# Altium project IoT-Speaker.PrjPcb (part 1 of 5)
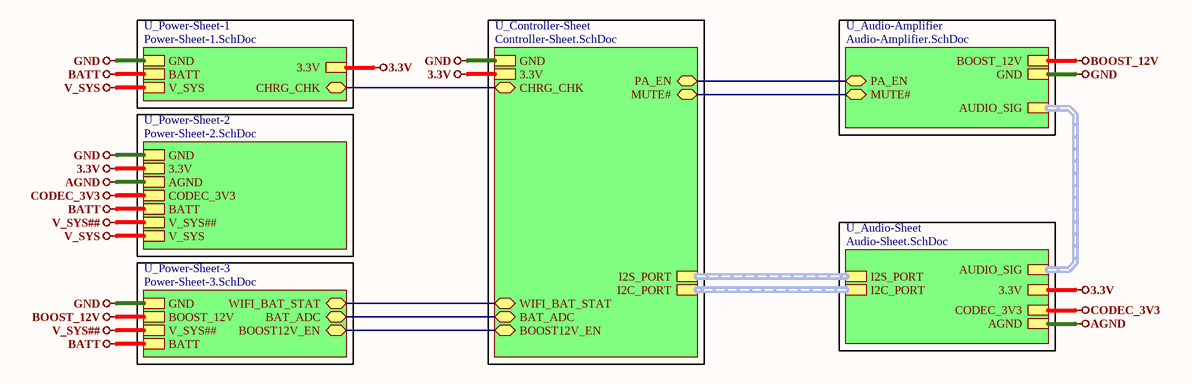
[diagram p0: Top-Sheet.SchDoc]
7 sheets, 210 parts. Net scope: hierarchical (ports join the sheet entries above them; power ports are global).
Board file: IOT_Speaker.PcbDoc
Sheets:
  Top-Sheet.SchDoc
    U_Audio-Amplifier = Audio-Amplifier.SchDoc
    U_Audio-Sheet = Audio-Sheet.SchDoc
    U_Controller-Sheet = Controller-Sheet.SchDoc
    U_Power-Sheet-2 = Power-Sheet-2.SchDoc
    U_Power-Sheet-3 = Power-Sheet-3.SchDoc
    U_Power-Sheet-1 = Power-Sheet-1.SchDoc

## Sheet Top-Sheet.SchDoc
size A4; SheetNumber: 1; SheetTotal: 7

### Sub-sheets
U_Audio-Amplifier = Audio-Amplifier.SchDoc: PA_EN (bidir), AUDIO_SIG (harness AUDIO_SIG), GND, BOOST_12V, MUTE# (bidir)
U_Audio-Sheet = Audio-Sheet.SchDoc: 3.3V, I2S_PORT (harness I2S_PORT), I2C_PORT (harness I2C_PORT), AGND, CODEC_3V3, AUDIO_SIG (harness AUDIO_SIG)
U_Controller-Sheet = Controller-Sheet.SchDoc: I2S_PORT (harness I2S_PORT), CHRG_CHK (bidir), BOOST12V_EN (bidir), GND, 3.3V, I2C_PORT (harness I2C_PORT), PA_EN (bidir), MUTE# (bidir), WIFI_BAT_STAT (bidir), BAT_ADC (bidir)
U_Power-Sheet-1 = Power-Sheet-1.SchDoc: GND, CHRG_CHK (bidir), BATT, V_SYS, 3.3V
U_Power-Sheet-2 = Power-Sheet-2.SchDoc: GND, 3.3V, AGND, CODEC_3V3, BATT, V_SYS##, V_SYS
U_Power-Sheet-3 = Power-Sheet-3.SchDoc: GND, BOOST_12V, BOOST12V_EN (bidir), V_SYS##, WIFI_BAT_STAT (bidir), BAT_ADC (bidir), BATT

### Nets
3.3V: sheet U_Audio-Sheet/3.3V, sheet U_Controller-Sheet/3.3V, sheet U_Power-Sheet-2/3.3V, sheet U_Power-Sheet-1/3.3V
AGND: sheet U_Audio-Sheet/AGND, sheet U_Power-Sheet-2/AGND
BATT: sheet U_Power-Sheet-2/BATT, sheet U_Power-Sheet-3/BATT, sheet U_Power-Sheet-1/BATT
BOOST_12V: sheet U_Audio-Amplifier/BOOST_12V, sheet U_Power-Sheet-3/BOOST_12V
CODEC_3V3: sheet U_Audio-Sheet/CODEC_3V3, sheet U_Power-Sheet-2/CODEC_3V3
GND: sheet U_Audio-Amplifier/GND, sheet U_Controller-Sheet/GND, sheet U_Power-Sheet-2/GND, sheet U_Power-Sheet-3/GND, sheet U_Power-Sheet-1/GND
V_SYS: sheet U_Power-Sheet-2/V_SYS, sheet U_Power-Sheet-1/V_SYS
V_SYS##: sheet U_Power-Sheet-2/V_SYS##, sheet U_Power-Sheet-3/V_SYS##
BAT_ADC: sheet U_Controller-Sheet/BAT_ADC, sheet U_Power-Sheet-3/BAT_ADC
BOOST12V_EN: sheet U_Controller-Sheet/BOOST12V_EN, sheet U_Power-Sheet-3/BOOST12V_EN
CHRG_CHK: sheet U_Controller-Sheet/CHRG_CHK, sheet U_Power-Sheet-1/CHRG_CHK
MUTE#: sheet U_Audio-Amplifier/MUTE#, sheet U_Controller-Sheet/MUTE#
PA_EN: sheet U_Audio-Amplifier/PA_EN, sheet U_Controller-Sheet/PA_EN
WIFI_BAT_STAT: sheet U_Controller-Sheet/WIFI_BAT_STAT, sheet U_Power-Sheet-3/WIFI_BAT_STAT

### Buses and harness runs
harness sheet U_Audio-Amplifier/AUDIO_SIG = sheet U_Audio-Sheet/AUDIO_SIG
harness sheet U_Audio-Sheet/I2C_PORT = sheet U_Controller-Sheet/I2C_PORT
harness sheet U_Audio-Sheet/I2S_PORT = sheet U_Controller-Sheet/I2S_PORT

### Notes on the sheet
- File:
- Title:
- Date:
- Page
- Num:
- Total:
- Drawn By: Huzaifa Ali

## Sheet Audio-Amplifier.SchDoc
size A4; SheetNumber: 7; SheetTotal: 7
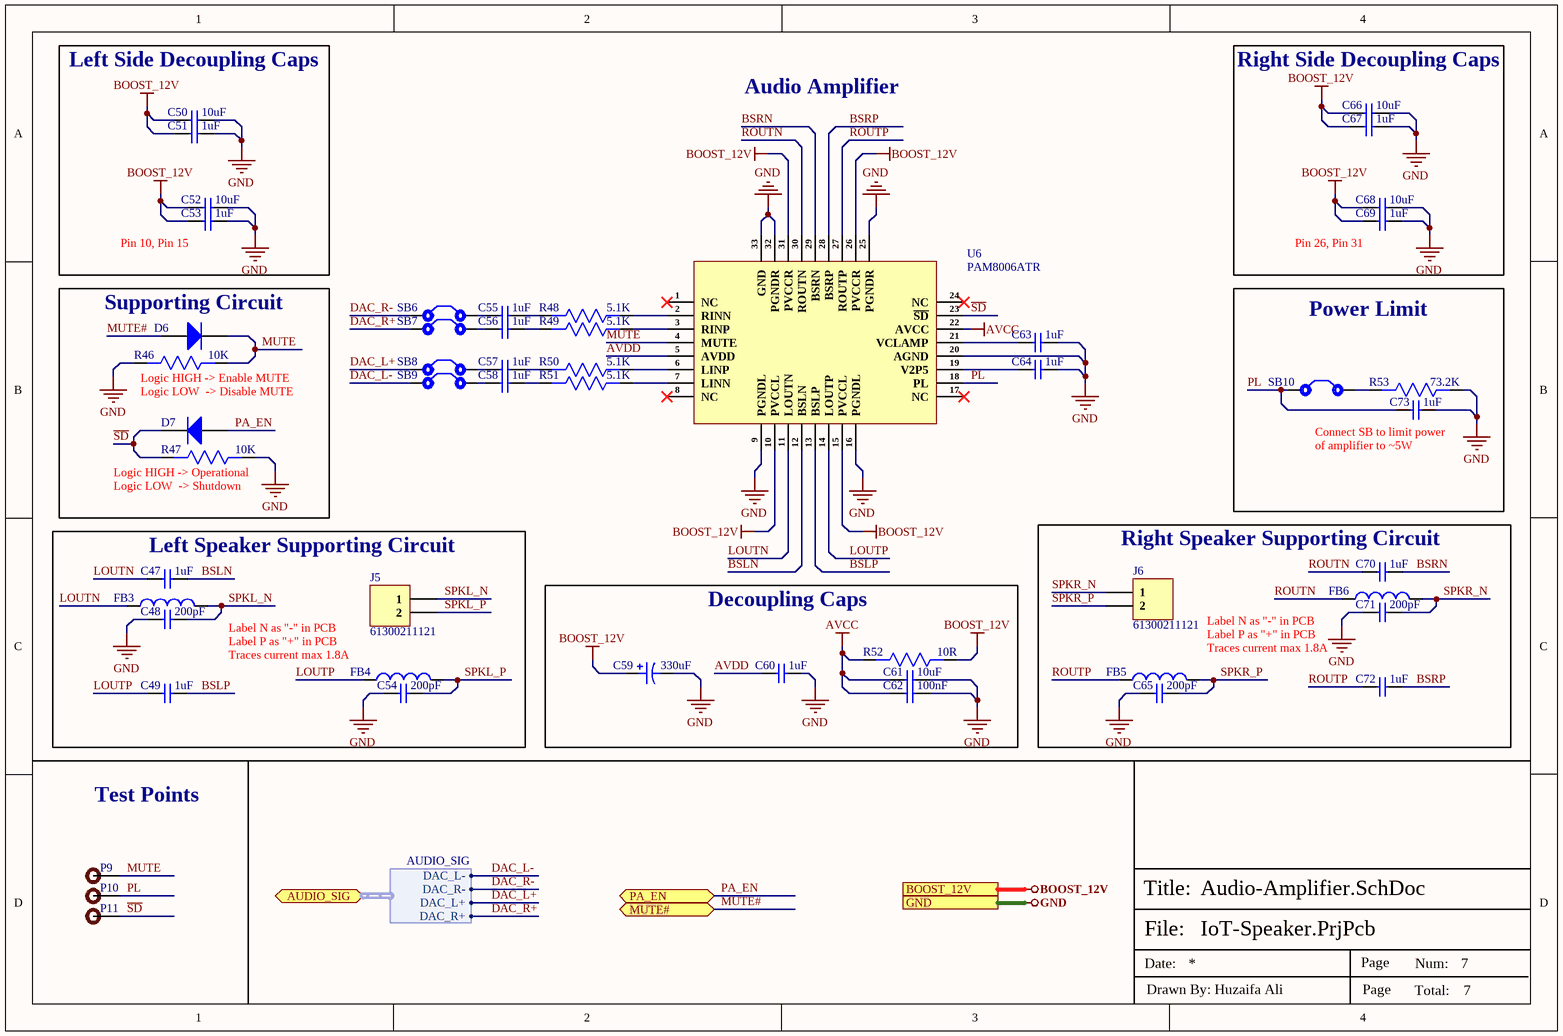
[diagram p1: Audio-Amplifier.SchDoc]

### Parts
C47  1uF  [Cap-0603]
C48  200pF  [Cap-0603]
C49  1uF  [Cap-0603]
C50  10uF  [Cap-0805]
C51  1uF  [Cap-0603]
C52  10uF  [Cap-0805]
C53  1uF  [Cap-0603]
C54  200pF  [Cap-0603]
C55  1uF  [Cap-0603]
C56  1uF  [Cap-0603]
C57  1uF  [Cap-0603]
C58  1uF  [Cap-0603]
C59  330uF  [25SVPF330M]
C60  1uF  [Cap-0603]
C61  10uF  [Cap-0805]
C62  100nF  [Cap-0402]
C63  1uF  [Cap-0603]
C64  1uF  [Cap-0603]
C65  200pF  [Cap-0603]
C66  10uF  [Cap-0805]
C67  1uF  [Cap-0603]
C68  10uF  [Cap-0805]
C69  1uF  [Cap-0603]
C70  1uF  [Cap-0603]
C71  200pF  [Cap-0603]
C72  1uF  [Cap-0603]
C73  1uF  [Cap-0603]
D6  1N4148WS-7-F  [SOD-323]  (value not drawn)
D7  1N4148WS-7-F  [SOD-323]  (value not drawn)
FB3  FBMH3225HM601NT  [IND-1210]  (value not drawn)
FB4  FBMH3225HM601NT  [IND-1210]  (value not drawn)
FB5  FBMH3225HM601NT  [IND-1210]  (value not drawn)
FB6  FBMH3225HM601NT  [IND-1210]  (value not drawn)
J5  61300211121  [HDR1X2_]
J6  61300211121  [HDR1X2_]
P9  TEST POINT  [Test-point]  (value not drawn)
P10  TEST POINT  [Test-point]  (value not drawn)
P11  TEST POINT  [Test-point]  (value not drawn)
R46  10K  [Res-0603]
R47  10K  [Res-0603]
R48  5.1K  [Res-0603]
R49  5.1K  [Res-0603]
R50  5.1K  [Res-0603]
R51  5.1K  [Res-0603]
R52  10R  [Res-0603]
R53  73.2K  [Res-0603]
SB6  Solder Bridge 0402  [Solder Bridge 0402]  (value not drawn)
SB7  Solder Bridge 0402  [Solder Bridge 0402]  (value not drawn)
SB8  Solder Bridge 0402  [Solder Bridge 0402]  (value not drawn)
SB9  Solder Bridge 0402  [Solder Bridge 0402]  (value not drawn)
SB10  Solder Bridge 0402  [Solder Bridge 0402]  (value not drawn)
U6  PAM8006ATR  [32-QFN]

### Blocks framed on the sheet
Left Side Decoupling Caps: C50-C53
Right Side Decoupling Caps: C66-C69
Supporting Circuit: D6 D7 R46 R47
Power Limit: C73 R53 SB10
Left Speaker Supporting Circuit: C47-C49 C54 FB3 FB4 J5
Right Speaker Supporting Circuit: C65 C70-C72 FB5 FB6 J6
Decoupling Caps: C59-C62 R52

### Ports
AUDIO_SIG (bidir, harness AUDIO_SIG), BOOST_12V, GND, MUTE# (bidir), PA_EN (bidir)

### Harnesses
AUDIO_SIG: DAC_L-, DAC_R-, DAC_L+, DAC_R+

### Nets
AVCC: C61.1 C62.1 R52.2 U6.22(AVCC)
BOOST_12V: C50.1 C51.1 C52.1 C53.1 C59.1 C66.1 C67.1 C68.1 C69.1 R52.1 U6.10(PVCCL) U6.15(PVCCL) U6.26(PVCCR) U6.31(PVCCR) ; port BOOST_12V
GND: C48.1 C50.2 C51.2 C52.2 C53.2 C54.1 C59.2 C60.2 C61.2 C62.2 C63.2 C64.2 C65.1 C66.2 C67.2 C68.2 C69.2 C71.1 C73.2 R46.2 R47.1 R53.1 U6.9(PGNDL) U6.16(PGNDL) U6.20(AGND) U6.25(PGNDR) U6.32(PGNDR) U6.33(GND) ; port GND
AVDD: C60.1 U6.5(AVDD)
BSLN: C47.2 U6.12(BSLN)
BSLP: C49.2 U6.13(BSLP)
BSRN: C70.2 U6.29(BSRN)
BSRP: C72.2 U6.28(BSRP)
DAC_L+: SB8.1 ; port AUDIO_SIG.DAC_L+
DAC_L-: SB9.1 ; port AUDIO_SIG.DAC_L-
DAC_R+: SB7.1 ; port AUDIO_SIG.DAC_R+
DAC_R-: SB6.1 ; port AUDIO_SIG.DAC_R-
LOUTN: C47.1 FB3.1 U6.11(LOUTN)
LOUTP: C49.1 FB4.1 U6.14(LOUTP)
MUTE: D6.1(K) P9.1 R46.1 U6.4(MUTE)
MUTE#: D6.2(A) ; port MUTE#
PA_EN: D7.2(A) ; port PA_EN
PL: C73.1 P10.1 SB10.1 U6.18(PL)
ROUTN: C70.1 FB6.1 U6.30(ROUTN)
ROUTP: C72.1 FB5.1 U6.27(ROUTP)
~{SD}: D7.1(K) P11.1 R47.2 U6.23(~{SD})
SPKL_N: C48.2 FB3.2 J5.1
SPKL_P: C54.2 FB4.2 J5.2
SPKR_N: C71.2 FB6.2 J6.1
SPKR_P: C65.2 FB5.2 J6.2
NetC55_1: C55.1 SB6.2
NetC55_2: C55.2 R48.2
NetC56_1: C56.1 SB7.2
NetC56_2: C56.2 R49.2
NetC57_1: C57.1 SB8.2
NetC57_2: C57.2 R50.2
NetC58_1: C58.1 SB9.2
NetC58_2: C58.2 R51.2
NetC63_1: C63.1 U6.21(VCLAMP)
NetC64_1: C64.1 U6.19(V2P5)
NetR48_1: R48.1 U6.2(RINN)
NetR49_1: R49.1 U6.3(RINP)
NetR50_1: R50.1 U6.6(LINP)
NetR51_1: R51.1 U6.7(LINN)
NetR53_2: R53.2 SB10.2

Not connected (* = marked no-connect by the designer): U6 1(NC)* 8(NC)* 17(NC)* 24(NC)*

### Notes on the sheet
- Audio Amplifier
- (near C53) Pin 10, Pin 15
- (near C69) Pin 26, Pin 31
- (near R46) Logic HIGH -> Enable MUTE
  Logic LOW  -> Disable MUTE
- (near C73) Connect SB to limit power of amplifier to ~5W
- (near R47) Logic HIGH -> Operational
  Logic LOW  -> Shutdown
- Label N as "-" in PCB
  Label P as "+" in PCB
  Traces current max 1.8A
- Test Points
- File:
- Title:
- Date:
- Page
- Num:
- Total:
- Drawn By: Huzaifa Ali

### Library data of the parts
C47 C49 C51 C53 C55-C58 C60 C63 C64 C67 C69 C70 C72 C73 = CC0603KRX5R8BB105: CAP CER 1UF 25V X5R 0603; Manufacturer: Yageo; Tolerance: 10%; Item Type: Capacitor; Supplier 1: Digi-Key; Manufacturer Part Number: CC0603KRX5R8BB105; RoHS: Yes; Category: Ceramic Capacitors; Stock 1: 919939; Pricing 1: 1=0.12000, 10=0.08400, 50=0.04760, 100=0.03940, 500=0.02764, 1000=0.02288 (USD); Mount: Surface Mount; Case/Package: 0603; Number of Pins: 2; Case Code (Metric): 1608; Case Code (Imperial): 0603; Min Operating Temperature: -55°C; Max Operating Temperature: 85°C; Capacitance: 1uF; Dielectric: X5R; Package Quantity: 1; Voltage Rating: 25V; Packaging: Tape and Reel; Termination: SMD/SMT; Voltage Rating (DC): 25V; Series: CC; Construction: Flat; Length: 1.6mm; Width: 0.031inch; Height: 0.8mm; Thickness: 0.035inch; Depth: 0.8mm; Radiation Hardening: No; REACH SVHC: No SVHC; Lead Free: Lead Free; Halogen Free: Halogen Free; RoHS Compliant: Yes; ComponentLink1URL: https://datasheet.ciiva.com/176/mlccorderingcode-176785.pdf?src-supplier=Digi-Key; ComponentLink1Description: https://datasheet.ciiva.com/176/mlccorderingcode-176785.pdf?src-supplier=Digi-Key; ComponentLink2URL: https://datasheet.ciiva.com/176/mlccorderingcode-176786.pdf?src-supplier=Digi-Key; ComponentLink2Description: https://datasheet.ciiva.com/176/mlccorderingcode-176786.pdf?src-supplier=Digi-Key; ComponentLink3URL: https://datasheet.ciiva.com/176/mlccorderingcode-176787.pdf?src-supplier=Digi-Key; ComponentLink3Description: https://datasheet.ciiva.com/176/mlccorderingcode-176787.pdf?src-supplier=Digi-Key; ComponentLink4URL: https://datasheet.ciiva.com/17436/upy-gphc-x5r-4v-to-50v-12-17436952.pdf?src-supplier=Avnet+Europe; ComponentLink4Description: https://datasheet.ciiva.com/17436/upy-gphc-x5r-4v-to-50v-12-17436952.pdf?src-supplier=Avnet+Europe; ComponentLink5URL: https://datasheet.ciiva.com/7978/1525783-7978171.pdf?src-supplier=Element14; ComponentLink5Description: https://datasheet.ciiva.com/7978/1525783-7978171.pdf?src-supplier=Element14; ComponentLink6URL: https://datasheet.ciiva.com/11586/upy-gphc-x5r-4v-to-50v-12-11586318.pdf?src-supplier=Avnet; ComponentLink6Description: https://datasheet.ciiva.com/11586/upy-gphc-x5r-4v-to-50v-12-11586318.pdf?src-supplier=Avnet; Supplier Part Number 1: 311-1445-1-ND; LCSC Part Number: C14664
C48 C54 C65 C71 = CC0603KRX7R9BB201: CAP CER 200PF 50V X7R 0603; Manufacturer: Yageo; Tolerance: 10%; Item Type: Capacitor; Supplier 1: Arrow Electronics; Manufacturer Part Number: CC0603KRX7R9BB201; RoHS: Yes; Category: Ceramic Capacitors; Stock 1: 6600; Pricing 1: 1=0.05400, 10=0.02000, 25=0.01980, 100=0.01530, 250=0.01520, 500=0.01090, 1000=0.00840, 3000=0.00810, 6000=0.00680 (USD); Mounting Technology: Surface Mount; Case/Package: 0603; Min Operating Temperature: -55°C; Max Operating Temperature: 125°C; Value: 200pF; Voltage Rating: 50V; Voltage Rating (DC): 50V; Packaging: Tape and Reel; Dielectric: X7R; Resistor Type: Ceramic; Series: CC; Construction: Flat; Length: 0.063inch; Width: 0.031inch; Thickness: 0.035inch; Depth: 0.8mm; Radiation Hardening: No; Lead Free: Lead Free; Halogen Free: Halogen Free; ComponentLink1URL: https://datasheet.ciiva.com/13210/upy-gphc-x7r-6-3v-to-50v-8-12304-13210555.pdf?src-supplier=Mouser; ComponentLink1Description: https://datasheet.ciiva.com/13210/upy-gphc-x7r-6-3v-to-50v-8-12304-13210555.pdf?src-supplier=Mouser; Supplier Part Number 1: CC0603KRX7R9BB201; LCSC Part Number: C107080
C50 C52 C61 C66 C68 = CC0805KKX5R8BB106: CAP CER 10UF 25V X5R 0805; Manufacturer: Yageo; Tolerance: 10%; Supplier 1: Digi-Key; Manufacturer Part Number: CC0805KKX5R8BB106; RoHS: Yes; Category: Ceramic Capacitors; Stock 1: 554290; Pricing 1: 1=0.31000, 10=0.21200, 50=0.14820, 100=0.12710, 500=0.09534, 1000=0.08050 (USD); Mount: Surface Mount; Case/Package: 0805; Case Code (Imperial): 0805; Case Code (Metric): 2012; Weight: 0.000194oz; Min Operating Temperature: -55°C; Max Operating Temperature: 85°C; Capacitance: 10uF; Voltage Rating (DC): 25V; Packaging: Tape and Reel; Voltage Rating: 25V; Dielectric: X5R; Termination: SMD/SMT; Resistor Type: Ceramic; Series: CC; Length: 0.079inch; Width: 0.049inch; Thickness: 0.057inch; Depth: 1.25mm; Lead Free: Lead Free; Halogen Free: Halogen Free; RoHS Compliant: Yes; ComponentLink1URL: http://www.mouser.com/ds/2/447/UPY-GPHC_X5R_4V-to-50V_25-1131599.pdf?src-supplier=Mouser; ComponentLink1Description: http://www.mouser.com/ds/2/447/UPY-GPHC_X5R_4V-to-50V_25-1131599.pdf?src-supplier=Mouser; ComponentLink2URL: http://www.yageo.com/documents/recent/UPY-GPHC_X5R_4V-to-50V_25.pdf?src-supplier=Digi-Key; ComponentLink2Description: http://www.yageo.com/documents/recent/UPY-GPHC_X5R_4V-to-50V_25.pdf?src-supplier=Digi-Key; Supplier Part Number 1: 311-1869-1-ND; LCSC Part Number: C89831
C59 = 25SVPF330M: CAP ALUM POLY 330UF 20% 25V SMD; Manufacturer: Panasonic; Ripple Current: 5A; Life (Hours): 5000Hour; ESR (Equivalent Series Resistance): 14mR; Polarity: Polar; Leakage Current: 1.65mA; Dissipation Factor: 12%; Item Type: Capacitor; Supplier 1: Avnet; Manufacturer Part Number: 25SVPF330M; RoHS: Yes; Category: Polymer Capacitors; Stock 1: 680; Pricing 1: 1=2.46000, 10=2.01000, 25=1.86000, 50=1.72000, 100=1.57000, 250=1.54000 (USD); Mount: Surface Mount; Case/Package: Radial; Number of Pins: 12; Min Operating Temperature: -55°C; Max Operating Temperature: 105°C; Tolerance: 20%; Packaging: Tape and Reel; Package Quantity: 400; Capacitance: 330uF; Voltage Rating: 25V; Voltage Rating (DC): 25V; Termination: SMD/SMT; Voltage: 25V; Series: OS-CON™, SVPF; Construction: Cylindrical; Ripple Current (AC): 5A; Diameter: 10mm; Length: 12.6mm; Height: 12.6mm; Height - Seated (Max): 0.5inch; Reach SVHC Compliant: Yes; Lead Free: Lead Free; RoHS Compliant: Yes; ComponentLink1URL: https://datasheet.ciiva.com/48542/svpf-eng-ds-48542398.pdf?src-supplier=Distrelec; ComponentLink1Description: https://datasheet.ciiva.com/48542/svpf-eng-ds-48542398.pdf?src-supplier=Distrelec; ComponentLink2URL: https://datasheet.ciiva.com/22746/1734360-22746217.pdf?src-supplier=Element14; ComponentLink2Description: https://datasheet.ciiva.com/22746/1734360-22746217.pdf?src-supplier=Element14; ComponentLink3URL: https://datasheet.ciiva.com/24216/svpf-os-262415-24216060.pdf?src-supplier=Mouser; ComponentLink3Description: https://datasheet.ciiva.com/24216/svpf-os-262415-24216060.pdf?src-supplier=Mouser; ComponentLink4URL: https://datasheet.ciiva.com/46650/70324301-46650266.pdf?src-supplier=Allied+Electronics; ComponentLink4Description: https://datasheet.ciiva.com/46650/70324301-46650266.pdf?src-supplier=Allied+Electronics; Supplier Part Number 1: 68AC5716; LCSC Part Number: C178367
C62 = CC0402KRX5R8BB104: CAP CER 0.1UF 25V X5R 0402; Manufacturer: Yageo; Tolerance: 10%; Item Type: Capacitor; Supplier 1: Digi-Key; Manufacturer Part Number: CC0402KRX5R8BB104; RoHS: Yes; Category: Ceramic Capacitors; Stock 1: 4598218; Pricing 1: 1=0.10000, 10=0.03800, 50=0.02100, 100=0.01710, 500=0.01224, 1000=0.00961, 2500=0.00874, 5000=0.00804 (USD); Mount: Surface Mount; Case/Package: 0402; Case Code (Metric): 1005; Case Code (Imperial): 0402; Min Operating Temperature: -55°C; Max Operating Temperature: 85°C; Voltage Rating: 25V; Packaging: Tape and Reel; Capacitance: 100nF; Voltage Rating (DC): 25V; Dielectric: X5R; Resistor Type: Ceramic; Series: CC; Length: 0.039inch; Width: 0.02inch; Thickness: 0.022inch; Depth: 0.5mm; Lead Free: Lead Free; Halogen Free: Halogen Free; RoHS Compliant: Yes; ComponentLink1URL: http://www.mouser.com/ds/2/447/UPY-GPHC_X5R_4V-to-50V_25-1131599.pdf?src-supplier=Mouser; ComponentLink1Description: http://www.mouser.com/ds/2/447/UPY-GPHC_X5R_4V-to-50V_25-1131599.pdf?src-supplier=Mouser; ComponentLink2URL: http://www.yageo.com/documents/recent/UPY-GPHC_X5R_4V-to-50V-16.pdf?src-supplier=Future+Electronics; ComponentLink2Description: http://www.yageo.com/documents/recent/UPY-GPHC_X5R_4V-to-50V-16.pdf?src-supplier=Future+Electronics; ComponentLink3URL: http://www.yageo.com/documents/recent/UPY-GPHC_X5R_4V-to-50V_25.pdf?src-supplier=Digi-Key; ComponentLink3Description: http://www.yageo.com/documents/recent/UPY-GPHC_X5R_4V-to-50V_25.pdf?src-supplier=Digi-Key; Supplier Part Number 1: 311-1697-1-ND; LCSC Part Number: C106256
D6 D7 = 1N4148WS-7-F: DIODE GEN PURP 75V 150MA SOD323; Manufacturer: Diodes; Forward Current: 300mA; Reverse Recovery Time: 4ns; Element Configuration: Single; Forward Voltage: 1.25V; Max Reverse Current: 1uA; Peak Non-Repetitive Surge Current: 2A; Power Dissipation: 200mW; Polarity: Standard; Capacitance: 2pF; Supplier 1: Mouser; Manufacturer Part Number: 1N4148WS-7-F; RoHS: Yes; Category: Rectifier Diodes; Pricing 1: 1=0.19000, 10=0.17500, 50=0.17500, 100=0.09600, 500=0.05900, 1000=0.04000, 3000=0.03000, 9000=0.02600, 10000=0.02600, 24000=0.02300, 45000=0.01900 (USD); Mount: Surface Mount; Number of Pins: 2; Weight: 0.000173oz; Contact Plating: Tin,Matte; Min Operating Temperature: -65°C; Max Operating Temperature: 150°C; Max Repetitive Reverse Voltage (Vrrm): 75V; Max Forward Surge Current (Ifsm): 2A; Max Surge Current: 2A; Packaging: Tape and Reel; Recovery Time: 4ns; Package Quantity: 3000; Average Rectified Current: 150mA; Voltage Rating (DC): 75V; Power Rating: 200mW; Current Rating: 150mA; Output Current: 150mA; Voltage: 75V; Max Reverse Voltage (DC): 75V; Series: -; Reverse Recovery Time-Max: 4ns; Length: 1.8mm; Width: 1.4mm; Height: 1mm; Radiation Hardening: No; REACH SVHC: No SVHC; Lead Free: Lead Free; RoHS Compliant: Yes; ComponentLink1URL: https://datasheet.ciiva.com/1179/ds30097-1179355.pdf?src-supplier=Element14; ComponentLink1Description: https://datasheet.ciiva.com/1179/ds30097-1179355.pdf?src-supplier=Element14; ComponentLink2URL: https://datasheet.ciiva.com/8300/ds30097-8300396.pdf?src-supplier=Avnet; ComponentLink2Description: https://datasheet.ciiva.com/8300/ds30097-8300396.pdf?src-supplier=Avnet; ComponentLink3URL: https://datasheet.ciiva.com/16199/ds30097-16199061.pdf?src-supplier=Future+Electronics; ComponentLink3Description: https://datasheet.ciiva.com/16199/ds30097-16199061.pdf?src-supplier=Future+Electronics; ComponentLink4URL: https://datasheet.ciiva.com/911/ds30097-911742.pdf?src-supplier=Digi-Key; ComponentLink4Description: https://datasheet.ciiva.com/911/ds30097-911742.pdf?src-supplier=Digi-Key; ComponentLink5URL: https://datasheet.ciiva.com/911/ds30097-911743.pdf?src-supplier=Digi-Key; ComponentLink5Description: https://datasheet.ciiva.com/911/ds30097-911743.pdf?src-supplier=Digi-Key; ComponentLink6URL: https://datasheet.ciiva.com/911/ds30097-911741.pdf?src-supplier=Digi-Key; ComponentLink6Description: https://datasheet.ciiva.com/911/ds30097-911741.pdf?src-supplier=Digi-Key; Supplier Part Number 1: 621-1N4148WS-F; LCSC Part Number: C60580; Item Type: Diode
FB3-FB6 = FBMH3225HM601NT: FERRITE BEAD 600 OHM 1210 1LN; Manufacturer: Taiyo Yuden; Impedance: 600R; DC Resistance (DCR): 42mR; Tolerance: 30%; Max DC Current: 3A; Number of Lines: 1; Test Frequency: 100MHz; Shielding: Unshielded; Supplier 1: Avnet; Manufacturer Part Number: FBMH3225HM601NT; RoHS: Yes; Category: Ferrite Beads and Chips; Stock 1: 56700; Pricing 1: 1000=0.11115, 2000=0.10925, 4000=0.10735, 6000=0.10545, 8000=0.10355 (USD); Mounting Technology: Surface Mount; Case/Package: 1210; Pins: 2; Core Material: Ferrite; Case Code (Metric): 3225; Case Code (Imperial): 1210; Material: Ferrite; Min Operating Temperature: -40°C; Max Operating Temperature: 125°C; Packaging: Tape and Reel; Current Rating: 3A; Package Quantity: 1; Max Current Rating: 3A; Termination: SMD/SMT; Series: FB; Frequency: 100MHz; Resistor Type: Ferrite Bead; Length: 3.2mm; Width: 0.098inch; Height: 2.8mm; Depth: 2.8mm; RoHS Compliant: Yes; Lead Free: Lead Free; Reach SVHC Compliant: Yes; Halogen Free: Halogen Free; ComponentLink1URL: https://datasheet.ciiva.com/6212/fbmh3225hm601nt-ss-6212657.pdf?src-supplier=Digi-Key; ComponentLink1Description: https://datasheet.ciiva.com/6212/fbmh3225hm601nt-ss-6212657.pdf?src-supplier=Digi-Key; ComponentLink2URL: https://datasheet.ciiva.com/16001/44fbmh3225hm601nt-16001086.pdf?src-supplier=Onlinecomponents.com; ComponentLink2Description: https://datasheet.ciiva.com/16001/44fbmh3225hm601nt-16001086.pdf?src-supplier=Onlinecomponents.com; ComponentLink3URL: https://datasheet.ciiva.com/25614/0900766b810b37be-25614375.pdf?src-supplier=Rs; ComponentLink3Description: https://datasheet.ciiva.com/25614/0900766b810b37be-25614375.pdf?src-supplier=Rs; ComponentLink4URL: https://datasheet.ciiva.com/7966/chipbeads01-e-7966154.pdf?src-supplier=Element14; ComponentLink4Description: https://datasheet.ciiva.com/7966/chipbeads01-e-7966154.pdf?src-supplier=Element14; ComponentLink5URL: https://datasheet.ciiva.com/1014/chipbeads01-e-1014606.pdf?src-supplier=Digi-Key; ComponentLink5Description: https://datasheet.ciiva.com/1014/chipbeads01-e-1014606.pdf?src-supplier=Digi-Key; ComponentLink6URL: https://datasheet.ciiva.com/1014/chipbeads01-e-1014605.pdf?src-supplier=Digi-Key; ComponentLink6Description: https://datasheet.ciiva.com/1014/chipbeads01-e-1014605.pdf?src-supplier=Digi-Key; Supplier Part Number 1: FBMH3225HM601NT; LCSC Part Number: C268004; Item Type: Ferrite Bead
J5 J6 = 61300211121: CONN HEADER VERT 2POS 2.54MM; Manufacturer: Wurth Electronics; Current Rating: 3A; Voltage Rating: 250V; Number of Positions: 2; Gender: Male; Connector Type: Male Pin; Pitch: 0.1inch; Supplier 1: Digi-Key; Manufacturer Part Number: 61300211121; Stock 1: 219205; Pricing 1: 1=0.13, 10=0.106, 25=0.088, 50=0.074, 100=0.067, 1000=0.061 (USD); Mount: Through Hole; Contact Plating: Gold; Housing Material: PBT; Contact Material: Copper Alloy,Copper; Color: Black; Min Operating Temperature: -40°C; Max Operating Temperature: 125°C; Number of Rows: 1; Contact Gender: Male; Packaging: Bulk; Termination: Through Hole; Number of Contacts: 2; Contact Mating Length: 0.236inch; REACH SVHC: Unknown; Lead Free: Lead Free; ComponentLink1URL: http://www.mouser.com/ds/2/445/6130xx11121-538006.pdf?src-supplier=Mouser; ComponentLink1Description: http://www.mouser.com/ds/2/445/6130xx11121-538006.pdf?src-supplier=Mouser; Supplier Part Number 1: 732-5315-ND; Item Type: Header
P9-P11 = TEST POINT: Test Point ON; Item Type: TEST POINT
R46 R47 = RC0603FR-0710KL: RES SMD 10K Ohm 1% 1/10W 0603; Manufacturer: Yageo; Resistance: 10kR; Temperature Coefficient: 100ppm/°C; Voltage Rating (DC): 50V; Power Rating: 100mW; Voltage Rating: 75V; Item Type: Resistor; Supplier 1: Digi-Key; Manufacturer Part Number: RC0603FR-0710KL; RoHS: Yes; Category: Chip SMD Resistors; Stock 1: 25249139; Pricing 1: 1=0.10000, 10=0.02400, 100=0.00970, 1000=0.00436, 2500=0.00378 (USD); Case/Package: 0603; Number of Pins: 2; Case Code (Imperial): 0603; Case Code (Metric): 1608; Weight: 7.1E-05oz; Size Code: 0603; Min Operating Temperature: -55°C; Max Operating Temperature: 155°C; Tolerance: 1%; Resistor Type: Thick Film; Packaging: Tape and Reel; Termination: SMD/SMT; Features: Moisture Resistant; Series: RC; Max Power Dissipation: 100mW; Number of Terminations: 2; Resistance Tolerance: 1%; Construction: Rectangular; Length: 1.6mm; Width: 0.8mm; Height: 0.45mm; Depth: 0.8mm; Lead Pitch: 0.3mm; REACH SVHC: Unknown; Lead Free: Lead Free; Military Standard: Not; RoHS Compliant: Yes; ComponentLink1URL: https://datasheet.ciiva.com/7660/38590-7660789.pdf?src-supplier=Element14; ComponentLink1Description: https://datasheet.ciiva.com/7660/38590-7660789.pdf?src-supplier=Element14; ComponentLink2URL: https://datasheet.ciiva.com/7983/443971-7983596.pdf?src-supplier=Element14; ComponentLink2Description: https://datasheet.ciiva.com/7983/443971-7983596.pdf?src-supplier=Element14; ComponentLink3URL: https://datasheet.ciiva.com/22747/443971-22747519.pdf?src-supplier=Element14; ComponentLink3Description: https://datasheet.ciiva.com/22747/443971-22747519.pdf?src-supplier=Element14; ComponentLink4URL: https://datasheet.ciiva.com/46440/1868787-46440891.pdf?src-supplier=Element14; ComponentLink4Description: https://datasheet.ciiva.com/46440/1868787-46440891.pdf?src-supplier=Element14; ComponentLink5URL: https://datasheet.ciiva.com/7746/1738695-7746239.pdf?src-supplier=Element14; ComponentLink5Description: https://datasheet.ciiva.com/7746/1738695-7746239.pdf?src-supplier=Element14; ComponentLink6URL: https://datasheet.ciiva.com/15189/getdatasheetpartid-409289-15189591.pdf?src-supplier=Verical; ComponentLink6Description: https://datasheet.ciiva.com/15189/getdatasheetpartid-409289-15189591.pdf?src-supplier=Verical; Supplier Part Number 1: 311-10.0KHRCT-ND; LCSC Part Number: C98220
R48-R51 = RC0603FR-075K1L: RES 5.1K OHM 1% 1/10W 0603; Manufacturer: Yageo; Power Rating: 100mW; Temperature Coefficient: 100ppm/°C; Resistance: 5.1kR; Voltage Rating: 50V; Item Type: Resistor; Supplier 1: Avnet; Manufacturer Part Number: RC0603FR-075K1L; RoHS: Yes; Category: Chip SMD Resistors; Stock 1: 100000; Pricing 1: 5000=0.00133, 10000=0.00131, 20000=0.00127 (USD); Case/Package: 0603; Number of Pins: 2; Case Code (Imperial): 0603; Case Code (Metric): 1608; Size Code: 0603; Min Operating Temperature: -55°C; Max Operating Temperature: 155°C; Tolerance: 1%; Series: RC; Packaging: Tape and Reel; Package Quantity: 1; Termination: SMD/SMT; Resistor Type: Thick Film; Number of Terminations: 2; Max Power Dissipation: 100mW; Voltage Rating (DC): 50V; Features: Moisture Resistant; Resistance Tolerance: 1%; Construction: Rectangular; Length: 0.063inch; Width: 0.031inch; Height: 0.022inch; Depth: 0.8mm; RoHS Compliant: Yes; Reach SVHC Compliant: Yes; Military Standard: Not; Lead Free: Lead Free; ComponentLink1URL: https://datasheet.ciiva.com/46395/443971-46395016.pdf?src-supplier=Element14; ComponentLink1Description: https://datasheet.ciiva.com/46395/443971-46395016.pdf?src-supplier=Element14; ComponentLink2URL: https://datasheet.ciiva.com/2454/pyu-r-int-thick-7-2454046.pdf?src-supplier=Digi-Key; ComponentLink2Description: https://datasheet.ciiva.com/2454/pyu-r-int-thick-7-2454046.pdf?src-supplier=Digi-Key; ComponentLink3URL: https://datasheet.ciiva.com/2454/pyu-r-int-thick-7-2454047.pdf?src-supplier=Digi-Key; ComponentLink3Description: https://datasheet.ciiva.com/2454/pyu-r-int-thick-7-2454047.pdf?src-supplier=Digi-Key; ComponentLink4URL: https://datasheet.ciiva.com/2454/pyu-r-int-thick-7-2454045.pdf?src-supplier=Digi-Key; ComponentLink4Description: https://datasheet.ciiva.com/2454/pyu-r-int-thick-7-2454045.pdf?src-supplier=Digi-Key; ComponentLink5URL: https://datasheet.ciiva.com/15189/getdatasheetpartid-326732-15189786.pdf?src-supplier=Verical; ComponentLink5Description: https://datasheet.ciiva.com/15189/getdatasheetpartid-326732-15189786.pdf?src-supplier=Verical; Supplier Part Number 1: RC0603FR-075K1L; LCSC Part Number: C105580
R52 = RC0603FR-0710RL: RES SMD 10 OHM 1% 1/10W 0603; Manufacturer: Yageo; Temperature Coefficient: 200ppm/°C; Power Rating: 100mW; Voltage Rating: 50V; Item type: Resistor; Supplier 1: Digi-Key; Manufacturer Part Number: RC0603FR-0710RL; Stock 1: 10836596; Pricing 1: 1=0.1, 10=0.046, 100=0.0187, 1000=0.0084, 2500=0.00729 (USD); Case/Package: 0603; Number of Pins: 2; Case Code (Imperial): 0603; Case Code (Metric): 1608; Contact Plating: Tin,Matte; Min Operating Temperature: -55°C; Max Operating Temperature: 155°C; Resistance: 10R; Tolerance: 1%; Composition: Thick Film; Packaging: Tape and Reel; Voltage Rating (DC): 50V; Termination: SMD/SMT; Military Standard: Not; Length: 1.6mm; Height: 0.45mm; Width: 0.8mm; Depth: 0.8mm; Radiation Hardening: No; Lead Free: Lead Free; REACH SVHC: No SVHC; ComponentLink1URL: http://www.farnell.com/datasheets/1868787.pdf?src-supplier=Element14; ComponentLink1Description: http://www.farnell.com/datasheets/1868787.pdf?src-supplier=Element14; ComponentLink2URL: http://www.yageo.com/documents/recent/PYu-RC0603_51_RoHS_L_4.pdf?src-supplier=Avnet; ComponentLink2Description: http://www.yageo.com/documents/recent/PYu-RC0603_51_RoHS_L_4.pdf?src-supplier=Avnet; ComponentLink3URL: http://documents.rs-components.com/techlib://itc_doclist_GB.htm?stockno=5048984&src-supplier=RSComponents; ComponentLink3Description: http://documents.rs-components.com/techlib://itc_doclist_GB.htm?stockno=5048984&src-supplier=RSComponents; ComponentLink4URL: http://www.yageo.com/documents/recent/PYu-RC0603_51_RoHS_L_4.pdf?src-supplier=Avnet+Europe; ComponentLink4Description: http://www.yageo.com/documents/recent/PYu-RC0603_51_RoHS_L_4.pdf?src-supplier=Avnet+Europe; Supplier Part Number 1: 311-10.0HRDKR-ND; LCSC Part Number: C109318
R53 = RC0603FR-0773K2L: RES 73.2K OHM 1% 1/10W 0603; Manufacturer: Yageo; Value: 73.2kR; Temperature Coefficient: 100ppm/°C; Power Rating: 100mW; Voltage Rating: 50V; Item Type: Resistor; Supplier 1: Future Electronics; Manufacturer Part Number: RC0603FR-0773K2L; RoHS: Yes; Category: Chip SMD Resistors; Stock 1: 410000; Pricing 1: 5000=0.00150, 75000=0.00140, 250000=0.00130, 750000=0.00130, 2500000=0.00120 (USD); Case/Package: 0603; Contact Plating: Tin,Matte; Case Code (Imperial): 0603; Case Code (Metric): 1608; Min Operating Temperature: -55°C; Max Operating Temperature: 155°C; Tolerance: 1%; Resistor Type: Thick Film; Packaging: Tape and Reel; Termination: SMD/SMT; Voltage Rating (DC): 50V; Features: Moisture Resistant; Series: RC; Max Power Dissipation: 100mW; Number of Terminations: 2; Construction: Rectangular; Length: 1.6mm; Width: 0.8mm; Height: 0.45mm; Depth: 0.8mm; Military Standard: Not; Lead Free: Lead Free; RoHS Compliant: Yes; ComponentLink1URL: https://datasheet.ciiva.com/8888/pyu-rc0603-51-rohs-l-4-8888325.pdf?src-supplier=Avnet; ComponentLink1Description: https://datasheet.ciiva.com/8888/pyu-rc0603-51-rohs-l-4-8888325.pdf?src-supplier=Avnet; Supplier Part Number 1: 8036170; LCSC Part Number: C163420
SB6-SB10 = Solder Bridge 0402: Solder Bridge ON; Manufacturer Part Number: Solder Bridge 0402; Item Type: Solder Bridge
U6 = PAM8006ATR: IC AMP AUDIO 15W CLASS D 32UQFN; Manufacturer: Diodes; Voltage Gain: 32dB; Min Supply Voltage: 8V; Max Supply Voltage: 18V; Max Output Power: 10W; Power Supply Rejection Ratio (PSRR): 65dB; Supplier 1: Rs; Manufacturer Part Number: PAM8006ATR; RoHS: Yes; Category: Amplifiers - Audio; Stock 1: 596; Pricing 1: 2=2.11500 (GBP); Mounting Technology: Surface Mount; Case/Package: QFN; Pins: 32; Min Operating Temperature: -20°C; Max Operating Temperature: 85°C; Packaging: Tape and Reel; Package Quantity: 3000; Series: -; Length: 5mm; Width: 5mm; Height: 0.75mm; Radiation Hardening: No; Lead Free: Lead Free; RoHS Compliant: Yes; ComponentLink1URL: https://datasheet.ciiva.com/24013/pam8006a-247273-24013164.pdf?src-supplier=Mouser; ComponentLink1Description: https://datasheet.ciiva.com/24013/pam8006a-247273-24013164.pdf?src-supplier=Mouser; ComponentLink2URL: https://datasheet.ciiva.com/29896/pam8006a-29896322.pdf?src-supplier=Avnet; ComponentLink2Description: https://datasheet.ciiva.com/29896/pam8006a-29896322.pdf?src-supplier=Avnet; ComponentLink3URL: https://datasheet.ciiva.com/30481/0900766b81268cf3-30481630.pdf?src-supplier=Rs; ComponentLink3Description: https://datasheet.ciiva.com/30481/0900766b81268cf3-30481630.pdf?src-supplier=Rs; Supplier Part Number 1: 7902950; LCSC Part Number: C167118; Item Type: IC